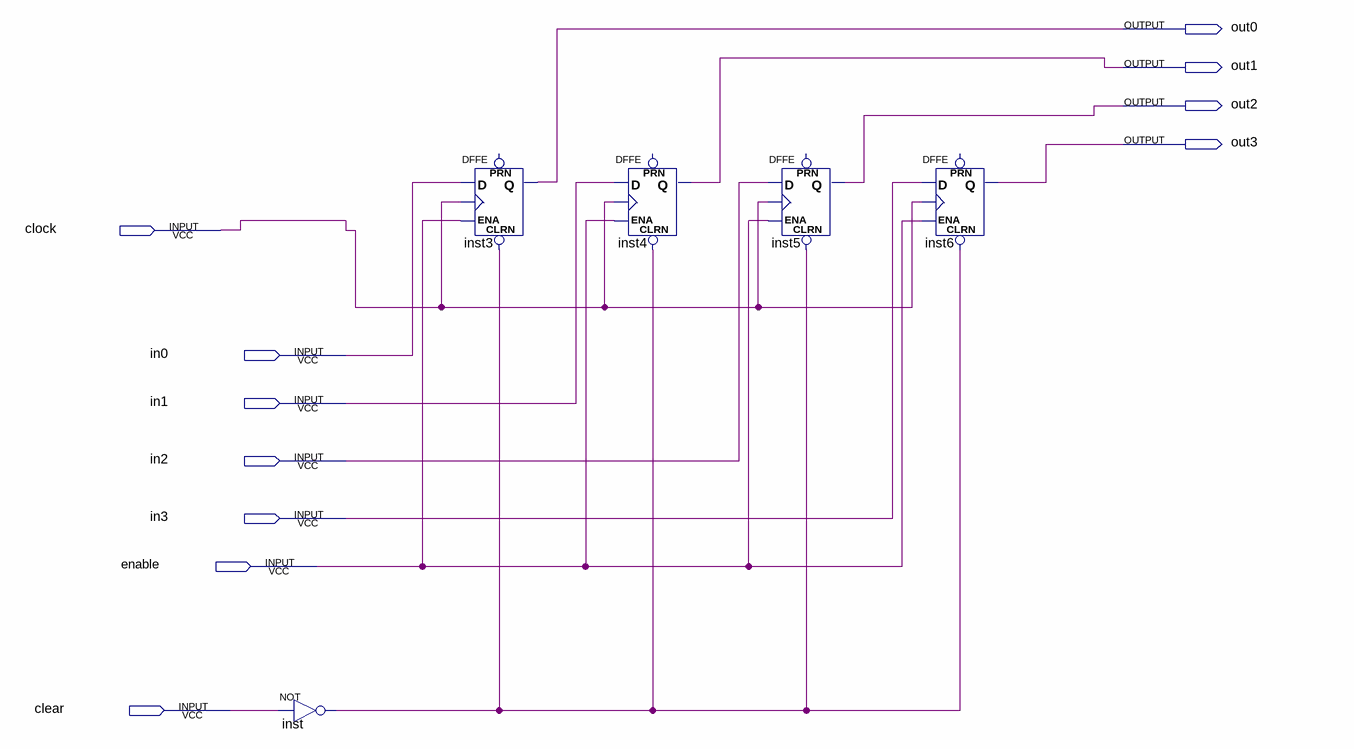
[diagram p0: schematic sheet]
// Quartus schematic registrador.bdf as structural Verilog: 5 symbols, 11 pins
module registrador (
  input  clock,
  input  in0,
  input  in1,
  input  in2,
  input  in3,
  input  enable,
  input  clear,
  output out0,
  output out1,
  output out2,
  output out3
);

  wire inst_out;

  not inst (inst_out, clear);
  DFFE inst3 (.CLRN(inst_out), .D(in0), .CLK(clock), .ENA(enable), .Q(out0));  // open: PRN
  DFFE inst4 (.CLRN(inst_out), .D(in1), .CLK(clock), .ENA(enable), .Q(out1));  // open: PRN
  DFFE inst5 (.CLRN(inst_out), .D(in2), .CLK(clock), .ENA(enable), .Q(out2));  // open: PRN
  DFFE inst6 (.CLRN(inst_out), .D(in3), .CLK(clock), .ENA(enable), .Q(out3));  // open: PRN
endmodule
